# Altium schematic sheet Processor.SchDoc
size A; SheetNumber: 1; SheetTotal: 3
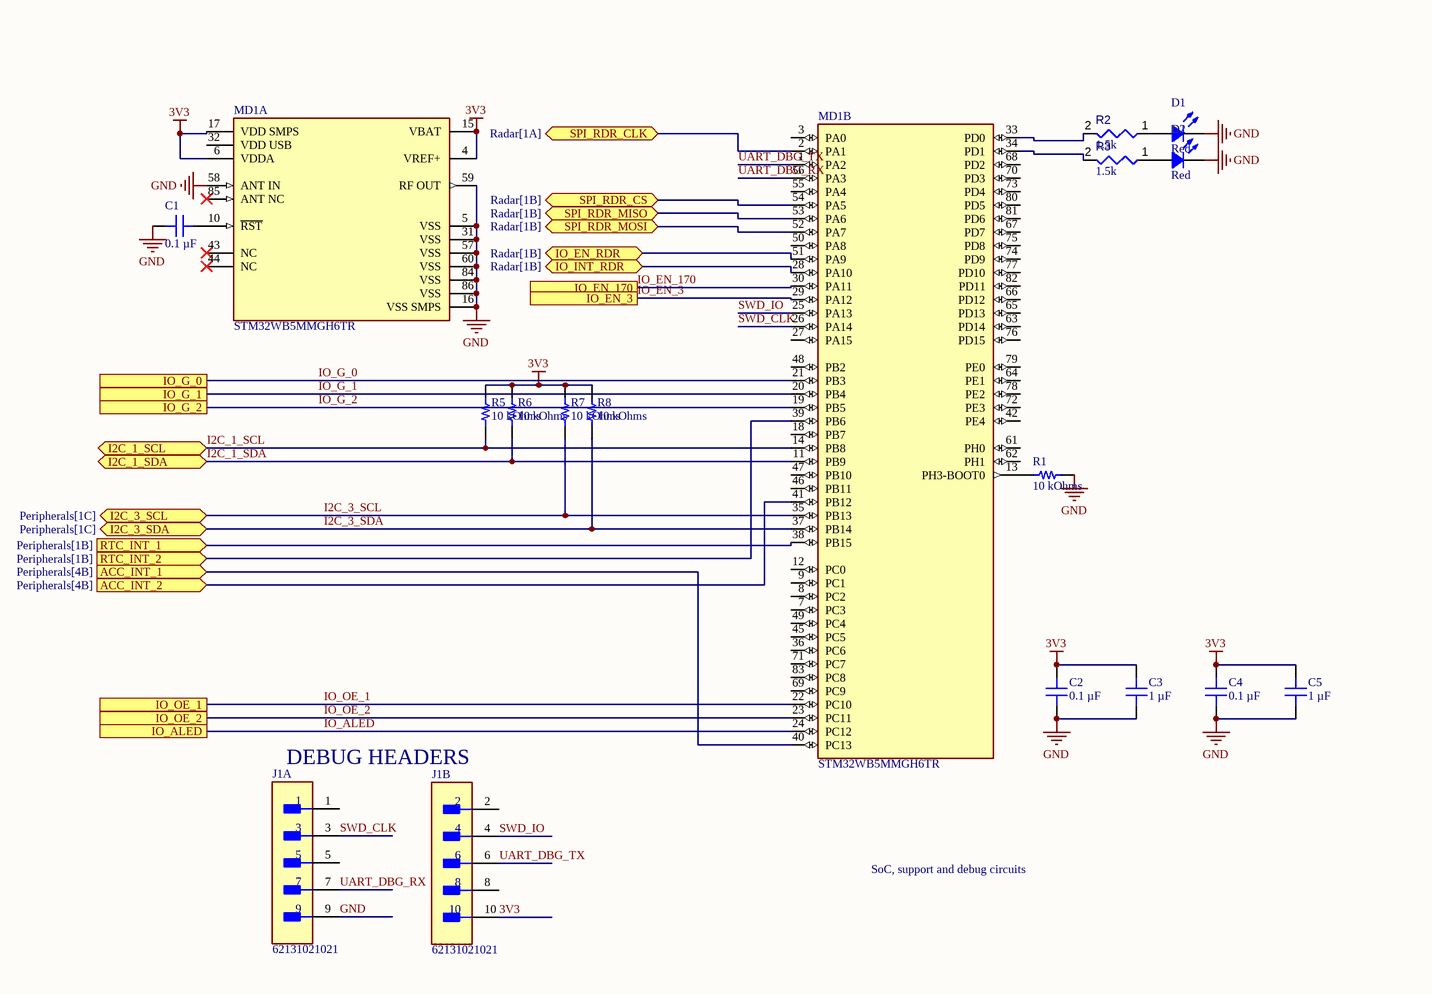
[diagram p0: Processor.SchDoc, left]
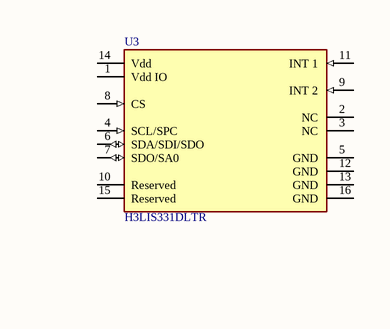
[diagram p1: Processor.SchDoc, right]

## Parts
C1  0.1 µF  [CAP 0402_1005]
C2  0.1 µF  [CAP 0402_1005]
C3  1 µF  [CAP 0402_1005]
C4  0.1 µF  [CAP 0402_1005]
C5  1 µF  [CAP 0402_1005]
D1  Red  [LED 0402_1005 YELLOW]
D2  Red  [LED 0402_1005 YELLOW]
J1  62131021021  [FP-62131021021-MFG]  (parts A,B of 2)
MD1  STM32WB5MMGH6TR  [FP-STM32WB5MMGH6TR-MFG]  (parts A,B of 2)
R1  10 kOhms  [RES 0402_1005]
R2  value 1.5k  [RESC1005X40X25ML05T05]  (hidden comment: Resistor 10k +/-1% 0402 63 mW)
R3  value 1.5k  [RESC1005X40X25ML05T05]  (hidden comment: Resistor 10k +/-1% 0402 63 mW)
R5  10 kOhms  [RES 0402_1005]
R6  10 kOhms  [RES 0402_1005]
R7  10 kOhms  [RES 0402_1005]
R8  10 kOhms  [RES 0402_1005]
U3  H3LIS331DLTR  [FP-TFLGA16-7983231-MFG]

## Ports
ACC_INT_1 (in, see Peripherals[4B]), ACC_INT_2 (in, see Peripherals[4B]), I2C_1_SCL (bidir), I2C_1_SDA (bidir), I2C_3_SCL (bidir, see Peripherals[1C]), I2C_3_SDA (bidir, see Peripherals[1C]), IO_ALED, IO_EN_3, IO_EN_170, IO_EN_RDR (bidir, see Radar[1B]), IO_G_0, IO_G_1, IO_G_2, IO_INT_RDR (bidir, see Radar[1B]), IO_OE_1, IO_OE_2, RTC_INT_1 (in, see Peripherals[1B]), RTC_INT_2 (in, see Peripherals[1B]), SPI_RDR_CLK (bidir, see Radar[1A]), SPI_RDR_CS (bidir, see Radar[1B]), SPI_RDR_MISO (bidir, see Radar[1B]), SPI_RDR_MOSI (bidir, see Radar[1B])

## Nets
3V3: C2.2 C3.2 C4.2 C5.2 J1.10 MD1.4(VREF+) MD1.6(VDDA) MD1.15(VBAT) MD1.17(VDD_SMPS) R5.1 R6.1 R7.1 R8.1
GND: C1.2 C2.1 C3.1 C4.1 C5.1 D1.2 D2.2 J1.9 MD1.5(VSS) MD1.16(VSS_SMPS) MD1.31(VSS) MD1.57(VSS) MD1.58(ANT_IN) MD1.59(RF_OUT) MD1.60(VSS) MD1.84(VSS) MD1.86(VSS) R1.1
ACC_INT_1: MD1.40(PC13) ; port ACC_INT_1
ACC_INT_2: MD1.41(PB12) ; port ACC_INT_2
I2C_1_SCL: MD1.14(PB8) R5.2 ; port I2C_1_SCL
I2C_1_SDA: MD1.11(PB9) R6.2 ; port I2C_1_SDA
I2C_3_SCL: MD1.35(PB13) R7.2 ; port I2C_3_SCL
I2C_3_SDA: MD1.37(PB14) R8.2 ; port I2C_3_SDA
IO_ALED: MD1.24(PC12) ; port IO_ALED
IO_EN_3: MD1.29(PA12) ; port IO_EN_3
IO_EN_170: MD1.30(PA11) ; port IO_EN_170
IO_EN_RDR: MD1.51(PA9) ; port IO_EN_RDR
IO_G_0: MD1.21(PB3) ; port IO_G_0
IO_G_1: MD1.20(PB4) ; port IO_G_1
IO_G_2: MD1.19(PB5) ; port IO_G_2
IO_INT_RDR: MD1.28(PA10) ; port IO_INT_RDR
IO_OE_1: MD1.22(PC10) ; port IO_OE_1
IO_OE_2: MD1.23(PC11) ; port IO_OE_2
RTC_INT_1: MD1.38(PB15) ; port RTC_INT_1
RTC_INT_2: MD1.39(PB6) ; port RTC_INT_2
SPI_RDR_CLK: MD1.2(PA1) ; port SPI_RDR_CLK
SPI_RDR_CS: MD1.54(PA5) ; port SPI_RDR_CS
SPI_RDR_MISO: MD1.53(PA6) ; port SPI_RDR_MISO
SPI_RDR_MOSI: MD1.52(PA7) ; port SPI_RDR_MOSI
SWD_CLK: J1.3 MD1.26(PA14)
SWD_IO: J1.4 MD1.25(PA13)
UART_DBG_RX: J1.7 MD1.56(PA3)
UART_DBG_TX: J1.6 MD1.1(PA2)
NetC1_1: C1.1 MD1.10(~{RST})
NetD1_1: D1.1 R2.1
NetD2_1: D2.1 R3.1
NetMD1_13: MD1.13(PH3-BOOT0) R1.2
NetMD1_33: MD1.33(PD0) R2.2
NetMD1_34: MD1.34(PD1) R3.2

Not connected (* = marked no-connect by the designer): J1 1 2 5 8; MD1 3(PA0) 7(PC3) 8(PC2) 9(PC1) 12(PC0) 18(PB7) 27(PA15) 32(VDD_USB) 36(PC6) 42(PE4) 43(NC)* 44(NC)* 45(PC5) 46(PB11) 47(PB10) 48(PB2) 49(PC4) 50(PA8) 55(PA4) 61(PH0) 62(PH1) 63(PD14) 64(PE1) 65(PD13) 66(PD12) 67(PD7) 68(PD2) 69(PC9) 70(PD3) 71(PC7) 72(PE3) 73(PD4) 74(PD9) 75(PD8) 76(PD15) 77(PD10) 78(PE2) 79(PE0) 80(PD5) 81(PD6) 82(PD11) 83(PC8) 85(ANT_NC)*; U3 1(Vdd_IO) 2(NC) 3(NC) 4(SCL/SPC) 5(GND) 6(SDA/SDI/SDO) 7(SDO/SA0) 8(CS) 9(INT_2) 10(Reserved) 11(INT_1) 12(GND) 13(GND) 14(Vdd) 15(Reserved) 16(GND)

## Notes on the sheet
- (near J1) DEBUG HEADERS
- SoC, support and debug circuits

## Library data of the parts
C1 C2 C4 = C0402C104K7PAC7867: CAP CER 0.1UF 4V X5R 0402; manufacturer: KEMET; Tolerance: ±10%; Part Number: C0402C104K7PAC7867; Value: 0.1 µF; Applications: Bypass, Decoupling; Capacitance: 0.1 µF; componentlink1description: Datasheet; componentlink1url: https://api.kemet.com/component-edge/download/datasheet/C0402C104K7PAC7867.pdf; componentlink2description: DigiKey Link; componentlink2url: https://www.digikey.com/en/products/detail/kemet/C0402C104K7PAC7867/7381987; Device Package: 0402 (1005 Metric); Lifecycle Status: Active; Minimum Order: 1; Mounting Type: Surface Mount, MLCC; Operating Temperature: -55°C ~ 85°C; Package / Case: 0402 (1005 Metric); packaging: TapeAndReel; partid: 5603; Part Status: Active; price: 0.01; series: SMD Comm X5R; Size / Dimension: 0.039" L x 0.020" W (1.00mm x 0.50mm); Supplier 1: DigiKey; Supplier Part Number 1: 399-14871-1-ND; Temperature Coefficient: X5R; Thickness (Max): 0.022" (0.55mm); Voltage - Rated: 4V
  C1: lastupdated: 1/9/2022 12:30:40 pm
  C2 C4: lastupdated: 11/9/2022 9:36:31 am
C3 C5 = LMK105C6105KV-F: CAP CER 1UF 10V X6S 0402; manufacturer: Taiyo Yuden; Tolerance: ±10%; Part Number: LMK105C6105KV-F; Value: 1 µF; Applications: SMPS Filtering; Capacitance: 1 µF; componentlink1description: Datasheet; componentlink1url: https://www.yuden.co.jp/productdata/catalog/mlcc01_e.pdf; componentlink2description: DigiKey Link; componentlink2url: https://www.digikey.com/en/products/detail/taiyo-yuden/LMK105C6105KV-F/4157226; Device Package: 0402 (1005 Metric); lastupdated: 11/9/2022 9:36:40 am; Lifecycle Status: Active; Minimum Order: 1; Mounting Type: Surface Mount, MLCC; Operating Temperature: -55°C ~ 105°C; Package / Case: 0402 (1005 Metric); packaging: TapeAndReel; partid: 2215; Part Status: Active; price: 0.01; series: M; Size / Dimension: 0.039" L x 0.020" W (1.00mm x 0.50mm); Supplier 1: DigiKey; Supplier Part Number 1: 587-3409-1-ND; Temperature Coefficient: X6S; Thickness (Max): 0.022" (0.55mm); Voltage - Rated: 10V
D1 D2 = BL-HKC37A-AV-TRB: 0402 RED; Manufacturer: American Bright Optoelectronics Corporation; Color: Yellow; Configuration: Standard; Current - Test: 20mA; Lens Color: Colorless; Lens Style: Rectangle with Flat Top; Lens Transparency: Clear; Millicandela Rating: 120mcd; Viewing Angle: 120°; Voltage - Forward (Vf) (Typ): 2.2V; Wavelength - Dominant: 589nm; Wavelength - Peak: 590nm; Part Number: BL-HKC37A-AV-TRB; ComponentLink1Description: Datasheet; ComponentLink1URL: https://americanbrightled.com/pdffiles/smt/BL-HKC37A-AV-TRB.pdf; ComponentLink2Description: DigiKey Link; ComponentLink2URL: https://www.digikey.com/en/products/detail/american-bright-optoelectronics-corporation/BL-HKC37A-AV-TRB/9678171; Device Package: 0402 (1005 Metric); Height (Max): 0.45mm; LastUpdated: 11/9/2022 10:29:51 am; Lifecycle Status: Active; Minimum Order: 1; Mounting Type: Surface Mount; Package / Case: 0402 (1005 Metric); Packaging: TapeAndReel; PartId: 1041; Part Status: Active; Price: 0.06; Series: -; Size / Dimension: 1.00mm L x 0.50mm W; Supplier 1: DigiKey; Supplier Part Number 1: BL-HKC37A-AV-TRBCT-ND; Supplier Device Package: 0402; Value: Red
J1 = CMP-1502-00938-2: 1.27mm SMT Straight Dual Pin Header WR-PHD; RoHS Compliant: Yes
MD1 = CMP-12160-000017-1: ULTRA-LOW-POWER DUAL CORE ARM CO
R1 R5-R8 = RP73PF1E10KBTD: RES 10K OHM 0.1% 1/10W 0402; Manufacturer: TE Connectivity Passive Product; Power (Watts): 0.1W, 1/10W; Temperature Coefficient: ±25ppm/°C; Part Number: RP73PF1E10KBTD; Value: 10 kOhms; ComponentLink1Description: Datasheet; ComponentLink1URL: https://www.te.com/commerce/DocumentDelivery/DDEController?Action=srchrtrv&DocNm=1773272&DocType=DS&DocLang=English; ComponentLink2Description: DigiKey Link; ComponentLink2URL: https://www.digikey.com/en/products/detail/te-connectivity-passive-product/RP73PF1E10KBTD/8260957; Composition: Thin Film; Device Package: 0402 (1005 Metric); Height - Seated (Max): 0.014" (0.35mm); LastUpdated: 1/9/2022 12:46:57 pm; Lifecycle Status: Active; Minimum Order: 1; Number of Terminations: 2; Operating Temperature: -55°C ~ 155°C; Package / Case: 0402 (1005 Metric); Packaging: TapeAndReel; PartId: 2434; Part Status: Active; Price: 0.09; Resistance: 10 kOhms; Series: RP73, Holsworthy; Size / Dimension: 0.039" L x 0.020" W (1.00mm x 0.50mm); Supplier 1: DigiKey; Supplier Part Number 1: A127415CT-ND; Supplier Device Package: 0402; Tolerance: ±0.1%
R2 R3 = CMP-009-00019-5: Chip Resistor, 1.5 KOhm, +/- 1%, 63 mW, -55 to 155 degC, 0402 (1005 Metric); Power: 63mW; Voltage Rating: 50V; Case/Package: 0402; Mounting Technology: SM; Pins: 2; Min Operating Temperature: -55°C; Tolerance: 1%; RoHS Compliant: True; Max Operating Temperature: 155°C
U3 = CMP-12175-000002-1: ACCEL 100-400G I2C/SPI 16TFLGA; Manufacturer: STMicroelectronics; Min Supply Voltage: 2.16V; Accel Axis: X+Y and Z; Sensor Output: I2C,SPI; Accel Resolution: 16bits; Operating Supply Current: 10-300uA; Accel Range: 100/200/400g; Max Supply Voltage: 3.6V; Temperature: -40°C to +85°C; Octopart: https://octopart.com/h3lis331dltr-stmicroelectronics-29186499; Automotive: No; Digikey Description: ACCEL 100-400G I2C/SPI 16TFLGA; Device Class L3: Accelerometers; ComponentLink2URL: https://www.st.com/resource/en/datasheet/h3lis331dl.pdf; Device Class L2: Motion Sensors; Package: TFLGA16-7983231; Mouser Description: Accelerometer Triple +/-100g/+/-200g/+/-400g 2.5V 16-Pin TFLGA T/R; ComponentLink2Description: Datasheet; Device Class L1: Sensors; Lead Free: Yes; RoHS: TRUE; Footprint Url: https://www.st.com/content/ccc/resource/technical/document/technical_note/73/17/9c/16/dd/96/4a/01/CD00134799.pdf/files/CD00134799.pdf/jcr:content/translations/en.CD00134799.pdf; Height: 1mm; Category: IC; Manufacturer Part Number: H3LIS331DLTR; Temperature Range Low: -40°C; Temperature Range High: +85°C